# Altium schematic sheet FPGA_PWR.SchDoc
size 297 x 209 mm
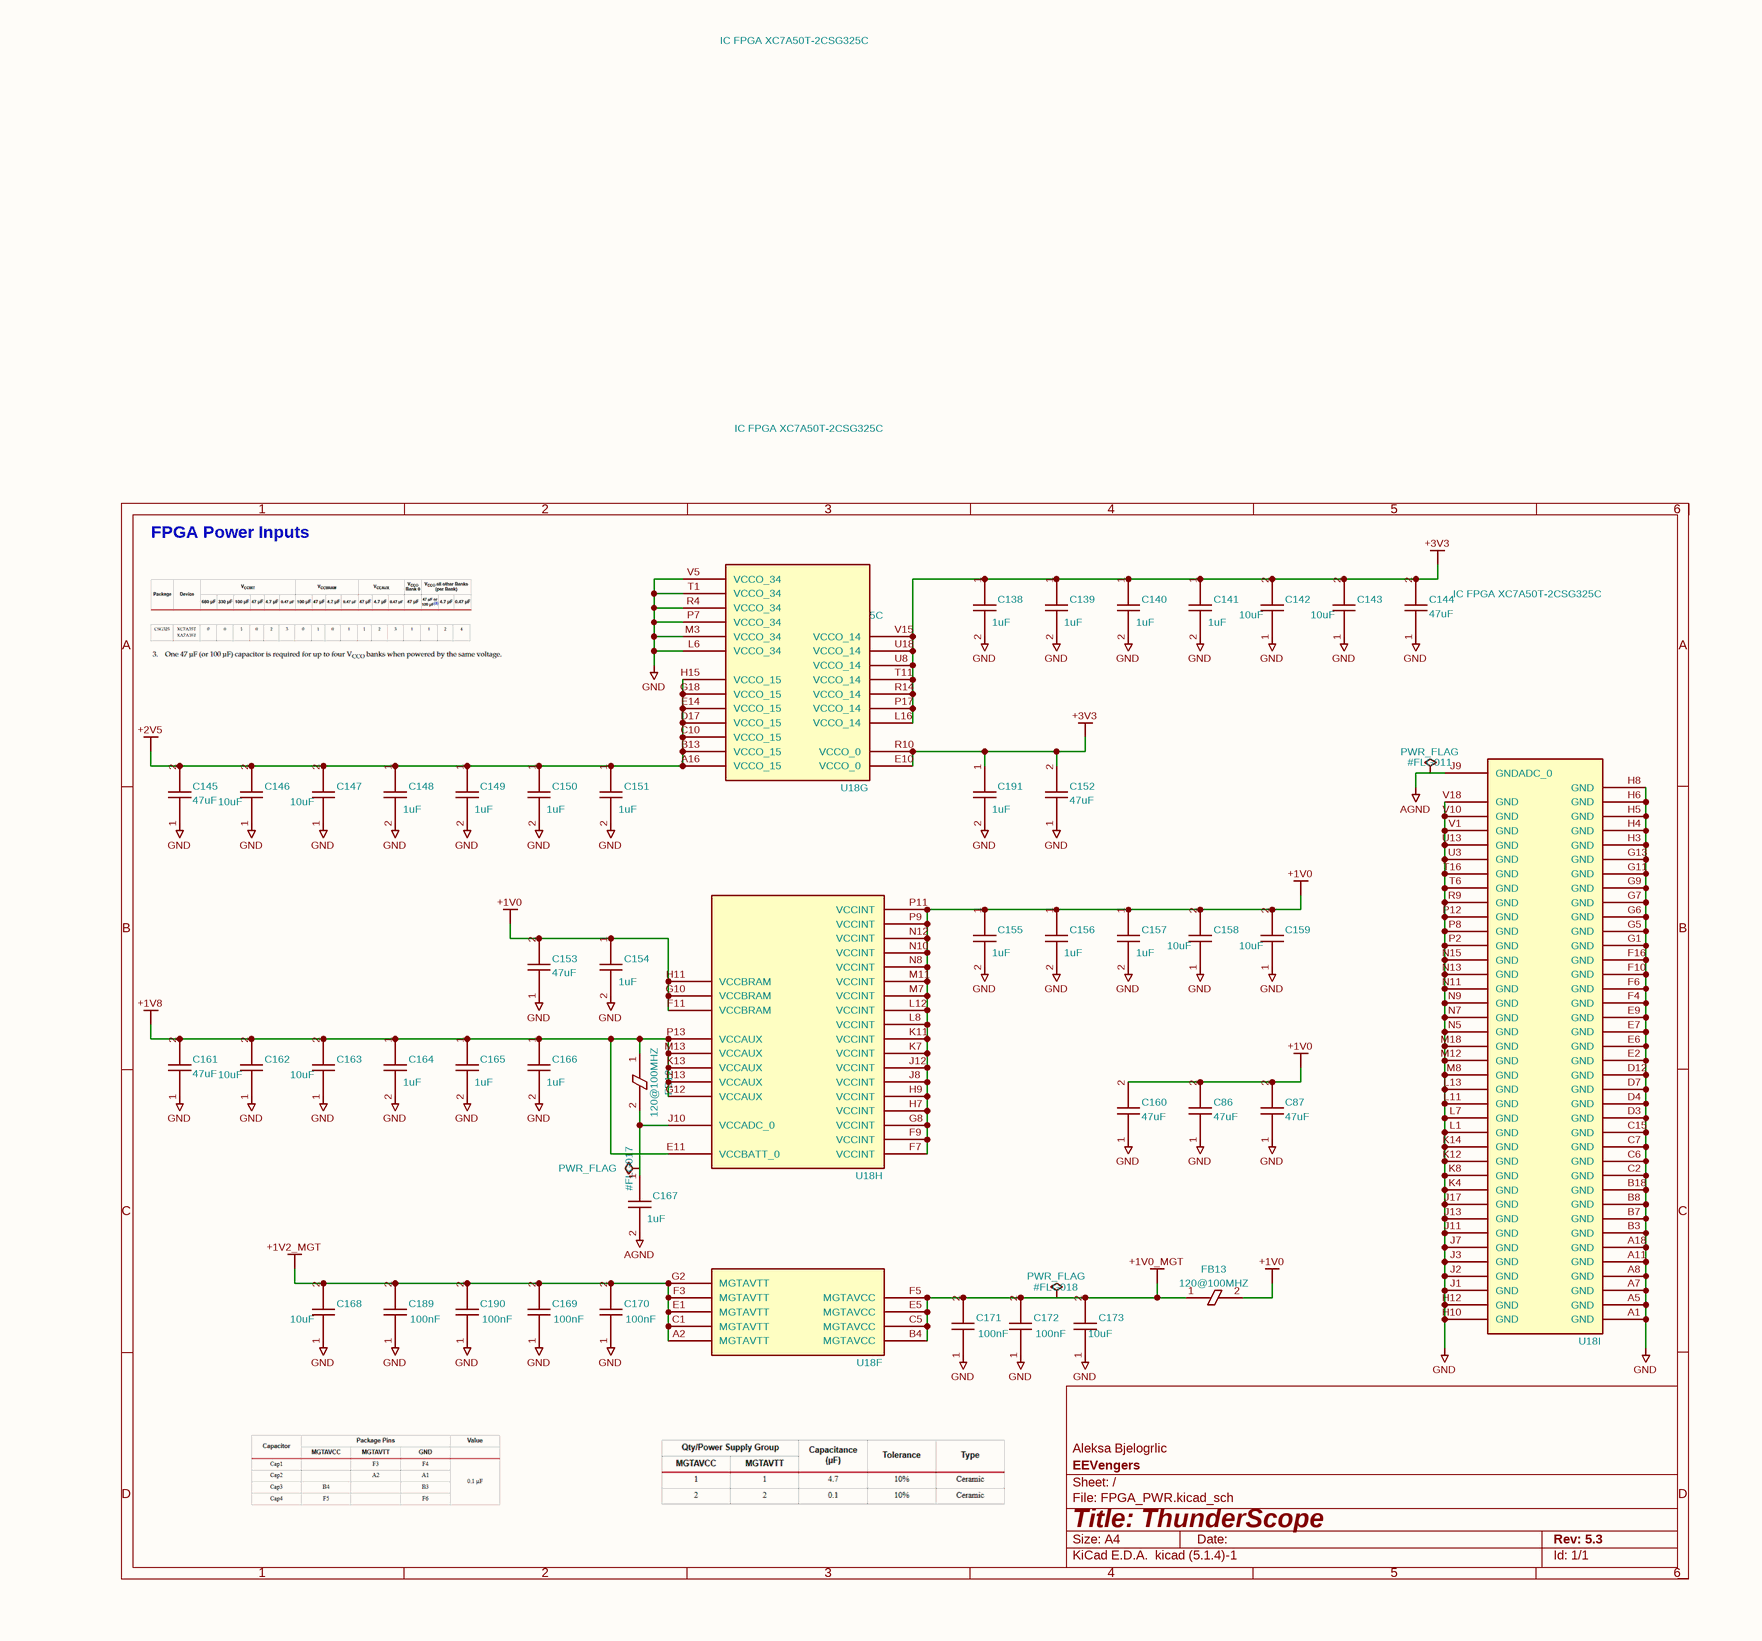
[diagram p0: FPGA_PWR.SchDoc]

## Parts
#FLG011  PWR_FLAG  (graphical)
#FLG017  PWR_FLAG  (graphical)
#FLG018  PWR_FLAG  (graphical)
C86  47uF  [GEN_C_0805]
C87  47uF  [GEN_C_0805]
C138  1uF  [GEN_C_0402]
C139  1uF  [GEN_C_0402]
C140  1uF  [GEN_C_0402]
C141  1uF  [GEN_C_0402]
C142  10uF  [GEN_C_0603]
C143  10uF  [GEN_C_0603]
C144  47uF  [GEN_C_0805]
C145  47uF  [GEN_C_0805]
C146  10uF  [GEN_C_0603]
C147  10uF  [GEN_C_0603]
C148  1uF  [GEN_C_0402]
C149  1uF  [GEN_C_0402]
C150  1uF  [GEN_C_0402]
C151  1uF  [GEN_C_0402]
C152  47uF  [GEN_C_0805]
C153  47uF  [GEN_C_0805]
C154  1uF  [GEN_C_0402]
C155  1uF  [GEN_C_0402]
C156  1uF  [GEN_C_0402]
C157  1uF  [GEN_C_0402]
C158  10uF  [GEN_C_0603]
C159  10uF  [GEN_C_0603]
C160  47uF  [GEN_C_0805]
C161  47uF  [GEN_C_0805]
C162  10uF  [GEN_C_0603]
C163  10uF  [GEN_C_0603]
C164  1uF  [GEN_C_0402]
C165  1uF  [GEN_C_0402]
C166  1uF  [GEN_C_0402]
C167  1uF  [GEN_C_0402]
C168  10uF  [GEN_C_0603]
C169  100nF  [GEN_C_0402]
C170  100nF  [GEN_C_0402]
C171  100nF  [GEN_C_0402]
C172  100nF  [GEN_C_0402]
C173  10uF  [GEN_C_0603]
C189  100nF  [GEN_C_0402]
C190  100nF  [GEN_C_0402]
C191  1uF  [GEN_C_0402]
FB12  120@100MHZ  [GEN_R_0402]
FB13  120@100MHZ  [GEN_R_0402]
U18  IC FPGA XC7A50T-2CSG325C  [XILINX_XC7A50T-2CSG325C]  (parts F,G,H,I of 9)

## Nets
+1V0: C86.2 C87.2 C153.2 C154.1 C155.1 C156.1 C157.1 C158.2 C159.2 C160.2 FB13.2 U18.F7(VCCINT) U18.F9(VCCINT) U18.F11(VCCBRAM) U18.G8(VCCINT) U18.G10(VCCBRAM) U18.H7(VCCINT) U18.H9(VCCINT) U18.H11(VCCBRAM) U18.J8(VCCINT) U18.J12(VCCINT) U18.K7(VCCINT) U18.K11(VCCINT) U18.L8(VCCINT) U18.L12(VCCINT) U18.M7(VCCINT) U18.M11(VCCINT) U18.N8(VCCINT) U18.N10(VCCINT) U18.N12(VCCINT) U18.P9(VCCINT) U18.P11(VCCINT)
+1V0_MGT: #FLG018.1 C171.2 C172.2 C173.2 FB13.1 U18.B4(MGTAVCC) U18.C5(MGTAVCC) U18.E5(MGTAVCC) U18.F5(MGTAVCC)
+1V2_MGT: C168.2 C169.2 C170.2 C189.2 C190.2 U18.A2(MGTAVTT) U18.C1(MGTAVTT) U18.E1(MGTAVTT) U18.F3(MGTAVTT) U18.G2(MGTAVTT)
+1V8: C161.2 C162.2 C163.2 C164.1 C165.1 C166.1 FB12.1 U18.E11(VCCBATT_0) U18.G12(VCCAUX) U18.H13(VCCAUX) U18.K13(VCCAUX) U18.M13(VCCAUX) U18.P13(VCCAUX)
+2V5: C145.2 C146.2 C147.2 C148.1 C149.1 C150.1 C151.1 U18.A16(VCCO_15) U18.B13(VCCO_15) U18.C10(VCCO_15) U18.D17(VCCO_15) U18.E14(VCCO_15) U18.G18(VCCO_15) U18.H15(VCCO_15)
+3V3: C138.1 C139.1 C140.1 C141.1 C142.2 C143.2 C144.2 C152.2 C191.1 U18.E10(VCCO_0) U18.L16(VCCO_14) U18.P17(VCCO_14) U18.R10(VCCO_0) U18.R14(VCCO_14) U18.T11(VCCO_14) U18.U8(VCCO_14) U18.U18(VCCO_14) U18.V15(VCCO_14)
AGND: #FLG011.1 C167.2 U18.J9(GNDADC_0)
GND: C86.1 C87.1 C138.2 C139.2 C140.2 C141.2 C142.1 C143.1 C144.1 C145.1 C146.1 C147.1 C148.2 C149.2 C150.2 C151.2 C152.1 C153.1 C154.2 C155.2 C156.2 C157.2 C158.1 C159.1 C160.1 C161.1 C162.1 C163.1 C164.2 C165.2 C166.2 C168.1 C169.1 C170.1 C171.1 C172.1 C173.1 C189.1 C190.1 C191.2 U18.A1(GND) U18.A5(GND) U18.A7(GND) U18.A8(GND) U18.A11(GND) U18.A18(GND) U18.B3(GND) U18.B7(GND) U18.B8(GND) U18.B18(GND) U18.C2(GND) U18.C6(GND) U18.C7(GND) U18.C15(GND) U18.D3(GND) U18.D4(GND) U18.D7(GND) U18.D12(GND) U18.E2(GND) U18.E6(GND) U18.E7(GND) U18.E9(GND) U18.F4(GND) U18.F6(GND) U18.F10(GND) U18.F16(GND) U18.G1(GND) U18.G5(GND) U18.G6(GND) U18.G7(GND) U18.G9(GND) U18.G11(GND) U18.G13(GND) U18.H3(GND) U18.H4(GND) U18.H5(GND) U18.H6(GND) U18.H8(GND) U18.H10(GND) U18.H12(GND) U18.J1(GND) U18.J2(GND) U18.J3(GND) U18.J7(GND) U18.J11(GND) U18.J13(GND) U18.J17(GND) U18.K4(GND) U18.K8(GND) U18.K12(GND) U18.K14(GND) U18.L1(GND) U18.L6(VCCO_34) U18.L7(GND) U18.L11(GND) U18.L13(GND) U18.M3(VCCO_34) U18.M8(GND) U18.M12(GND) U18.M18(GND) U18.N5(GND) U18.N7(GND) U18.N9(GND) U18.N11(GND) U18.N13(GND) U18.N15(GND) U18.P2(GND) U18.P7(VCCO_34) U18.P8(GND) U18.P12(GND) U18.R4(VCCO_34) U18.R9(GND) U18.T1(VCCO_34) U18.T6(GND) U18.T16(GND) U18.U3(GND) U18.U13(GND) U18.V1(GND) U18.V5(VCCO_34) U18.V10(GND) U18.V18(GND)
Net#FLG017_1: #FLG017.1 C167.1 FB12.2 U18.J10(VCCADC_0)

## Notes on the sheet
- FPGA Power Inputs
- 1
- 2
- 3
- 4
- 5
- 6
- A
- B
- C
- Aleksa Bjelogrlic
- D
- Title: ThunderScope
- File: FPGA_PWR.kicad_sch
- Sheet: /
- EEVengers
- KiCad E.D.A.  kicad (5.1.4)-1
- Size: A4
- Date:
- Rev: 5.3
- Id: 1/1

## Library data of the parts
C86 C87 C144 C145 C152 C153 C160 C161 = CAP 47uF 6.3V X5R 0805: HOUSE PART NUMBER: C-47uF-0805-002; MANUFACTURER: Samsung; MANUFACTURER PART NUMBER: CL21A476MQYNNNE; VOLTAGE RATING: 6.3V; Substitutions Policy: Any Parametric Equivalent; PACKAGE: 0805; SUPPLIER 1: Mouser; SUPPLIER PART NUMBER 1: 187-CL32A226KPJNNNE; Footprint: Thunderscope_Rev5:GEN_C_0805; Value: 47uF
C138-C141 C148-C151 C154-C157 C164-C167 C191 = CAP 1uF 25V X5R 0402: MANUFACTURER: Murata; MANUFACTURER PART NUMBER: GRM155R61E105KA12D; VOLTAGE RATING: 25V; Substitutions Policy: Any Parametric Equivalent; PACKAGE: 0402; SUPPLIER 1: Mouser; SUPPLIER PART NUMBER 1: 81-GRM155R61E105KA2D; Footprint: Thunderscope_Rev5:GEN_C_0402; Value: 1uF
C142 C143 C146 C147 C158 C159 C162 C163 C168 C173 = CAP 10uF 25V X5R 0603: MANUFACTURER: Murata; MANUFACTURER PART NUMBER: GRM188R61E106MA73D; VOLTAGE RATING: 25V; Substitutions Policy: Any Parametric Equivalent; PACKAGE: 0402; SUPPLIER 1: Mouser; SUPPLIER PART NUMBER 1: 81-GRM188R61E106MA3D; Footprint: Thunderscope_Rev5:GEN_C_0603; Value: 10uF
C169-C172 C189 C190 = CAP 100nF 16V X7R 0402: HOUSE PART NUMBER: C-100nF-0402-002; MANUFACTURER: Murata; MANUFACTURER PART NUMBER: GCM155R71C104KA55D; VOLTAGE RATING: 16V; Substitutions Policy: Any Parametric Equivalent; PACKAGE: 0402; SUPPLIER 1: Mouser; SUPPLIER PART NUMBER 1: 81-GCM155R71C104KA5D; Footprint: Thunderscope_Rev5:GEN_C_0402; Value: 100nF
FB12 FB13 = FERRITE BEAD 120 OHM 0402: HOUSE PART NUMBER: BLM15PX121SN1D; MANUFACTURER: Murata; Substitutions Policy: No Substitutions; SUPPLIER 1: Mouser; SUPPLIER PART NUMBER 1: 81-BLM15PX121SN1D; MANUFACTURER PART NUMBER: BLM15PX121SN1D; PACKAGE: 0402; Footprint: Thunderscope_Rev5:GEN_R_0402; Value: 120@100MHZ
U18 = IC FPGA XC7A50T-2CSG325C: MANUFACTURER: Xilinx; Substitutions Policy: No Substitutions; HOUSE PART NUMBER: XC7A50T-2CSG325C; MANUFACTURER PART NUMBER: XC7A50T-2CSG325C; SUPPLIER 1: Digi-Key; SUPPLIER PART NUMBER 1: 122-2193-ND; PACKAGE: 324-BGA (15x15mm); Value: IC FPGA XC7A50T-2CSG325C; Footprint: Thunderscope_Rev5:XILINX_XC7A50T-2CSG325C
#FLG011 #FLG017 #FLG018 = PWR_FLAG: Value: PWR_FLAG